# Altium schematic sheet Connectors.SchDoc
size A; SheetNumber: 2; SheetTotal: 3
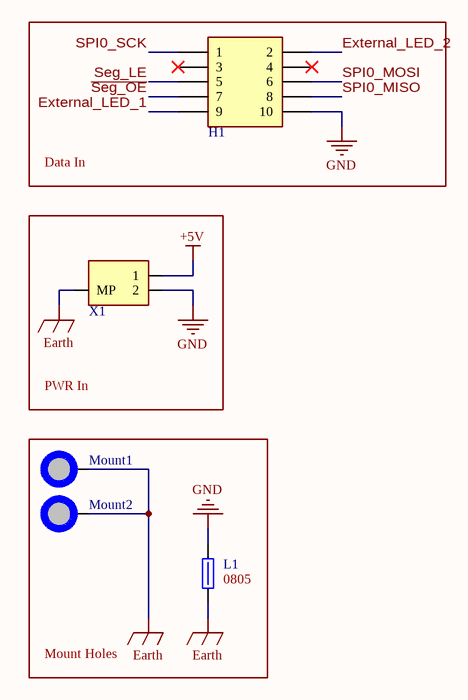
[diagram p0: Connectors.SchDoc]

## Parts
H1  2x5 Shrouded  [[Rectangular] Shrouded 2x5 Male]  (value not drawn)
L1  Size Package: 0805  [[Ferrite] SMD 0805]  (hidden comment: 652-MH2029-300Y)
Mount1  M3 Mount Hole  [[Mount] M3 Mount Hole]  (value not drawn)  (no BOM)
Mount2  M3 Mount Hole  [[Mount] M3 Mount Hole]  (value not drawn)  (no BOM)
X1  [Pheonix] 2pin 2.5mm pitch  [[Pheonix] 2pin 2.5mm pitch]  (value not drawn)

## Blocks framed on the sheet
Data In: H1
PWR In: X1
Mount Holes: L1 Mount1 Mount2

## Nets
+5V: X1.1
Earth: L1.1 Mount1.1 Mount2.1 X1.MP
GND: H1.10 L1.2 X1.2
~{Seg_OE}: H1.7
External_LED_1: H1.9
External_LED_2: H1.2
Seg_LE: H1.5
SPI0_MISO: H1.8
SPI0_MOSI: H1.6
SPI0_SCK: H1.1

Not connected (* = marked no-connect by the designer): H1 3* 4*

## Library data of the parts
H1 = [Rectangular] Shrouded 2x5 Male: BHR-10-VUA; System: Connector; Supplier 1: DigiKey; Supplier Part Number 1: 2057-BHR-10-VUA-ND
L1 = [Ferrite] SMD 0805 3A 30ohm: Res @ Freq: 30 @ 100MHz; Supplier 1: DigiKey; Supplier Part Number 1: MH2029-300YCT-ND
Mount1 Mount2 = [Mount] M3 Mount Hole: Place at least 4.5mm from board edge. Plated.
X1 = [Pheonix] 2pin 2.5mm pitch: 1778764; System: Connector; Supplier 1: DigiKey; Supplier Part Number 1: 277-2315-1-ND